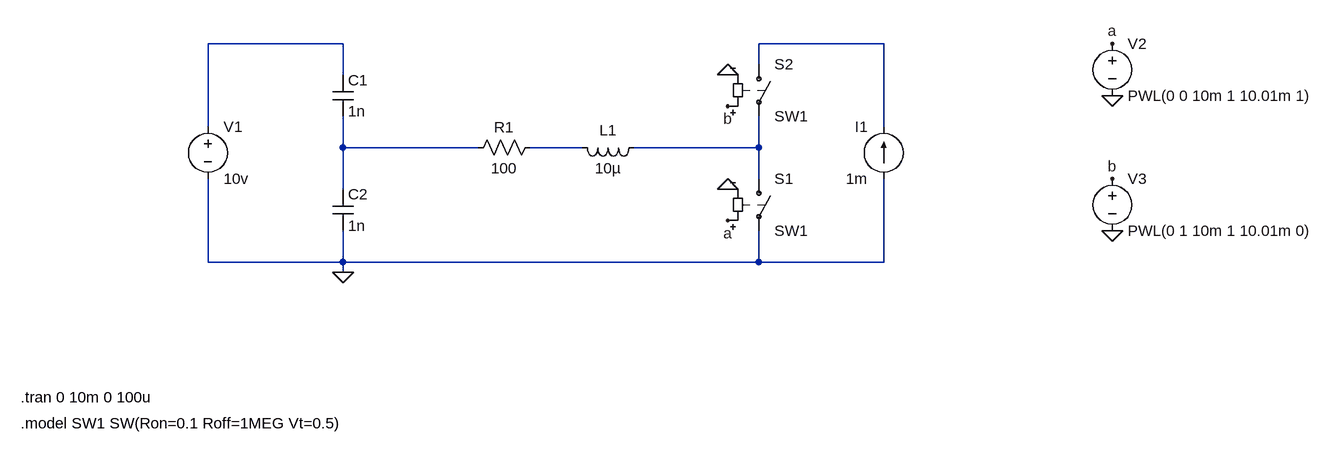
[diagram p0: schematic Draft1.asc]
Draft1.asc, the LTspice schematic file:
Version 4.1
SHEET 1 1484 680
WIRE -32 -64 -240 -64
WIRE 800 -64 608 -64
WIRE 608 -32 608 -64
WIRE -32 -16 -32 -64
WIRE -240 64 -240 -64
WIRE 800 64 800 -64
WIRE -32 96 -32 48
WIRE 176 96 -32 96
WIRE 336 96 256 96
WIRE 608 96 608 48
WIRE 608 96 416 96
WIRE 608 144 608 96
WIRE -32 160 -32 96
WIRE -240 272 -240 144
WIRE -32 272 -32 224
WIRE -32 272 -240 272
WIRE 608 272 608 224
WIRE 608 272 -32 272
WIRE 800 272 800 144
WIRE 800 272 608 272
WIRE -32 288 -32 272
FLAG -32 288 0
FLAG 1152 -64 a
FLAG 560 208 a
FLAG 1152 144 b
FLAG 560 32 b
FLAG 560 -16 0
FLAG 560 160 0
FLAG 1152 16 0
FLAG 1152 224 0
SYMBOL ind 432 80 R90
WINDOW 0 5 56 VBottom 2
WINDOW 3 32 56 VTop 2
SYMATTR InstName L1
SYMATTR Value 10µ
SYMBOL res 272 80 R90
WINDOW 0 0 56 VBottom 2
WINDOW 3 32 56 VTop 2
SYMATTR InstName R1
SYMATTR Value 100
SYMBOL cap -48 -16 R0
SYMATTR InstName C1
SYMATTR Value 1n
SYMBOL cap -48 160 R0
SYMATTR InstName C2
SYMATTR Value 1n
SYMBOL voltage -240 48 R0
WINDOW 123 0 0 Left 0
WINDOW 39 0 0 Left 0
SYMATTR InstName V1
SYMATTR Value 10v
SYMBOL sw 608 128 R0
SYMATTR InstName S1
SYMATTR Value SW1
SYMBOL sw 608 -48 R0
SYMATTR InstName S2
SYMATTR Value SW1
SYMBOL current 800 144 R180
WINDOW 0 24 80 Left 2
WINDOW 3 24 0 Left 2
WINDOW 123 0 0 Left 0
WINDOW 39 0 0 Left 0
SYMATTR InstName I1
SYMATTR Value 1m
SYMBOL voltage 1152 -80 R0
WINDOW 123 0 0 Left 0
WINDOW 39 0 0 Left 0
SYMATTR InstName V2
SYMATTR Value PWL(0 0 10m 1 10.01m 1)
SYMBOL voltage 1152 128 R0
WINDOW 123 0 0 Left 0
WINDOW 39 0 0 Left 0
SYMATTR InstName V3
SYMATTR Value PWL(0 1 10m 1 10.01m 0)
TEXT -528 480 Left 2 !.tran 0 10m 0 100u
TEXT -528 520 Left 2 !.model SW1 SW(Ron=0.1 Roff=1MEG Vt=0.5)

The netlist it stands for:
* Draft1.asc
L1 N005 N004 10µ
R1 N004 N003 100
C1 N001 N003 1n
C2 N003 0 1n
V1 N001 0 10v
S1 N005 0 a 0 SW1
S2 N002 N005 b 0 SW1
I1 0 N002 1m
V2 a 0 PWL(0 0 10m 1 10.01m 1)
V3 b 0 PWL(0 1 10m 1 10.01m 0)
.tran 0 10m 0 100u
.model SW1 SW(Ron=0.1 Roff=1MEG Vt=0.5)
.backanno
.end